# Altium schematic sheet Power-Sheet-2.SchDoc
size A4; SheetNumber: 3; SheetTotal: 10
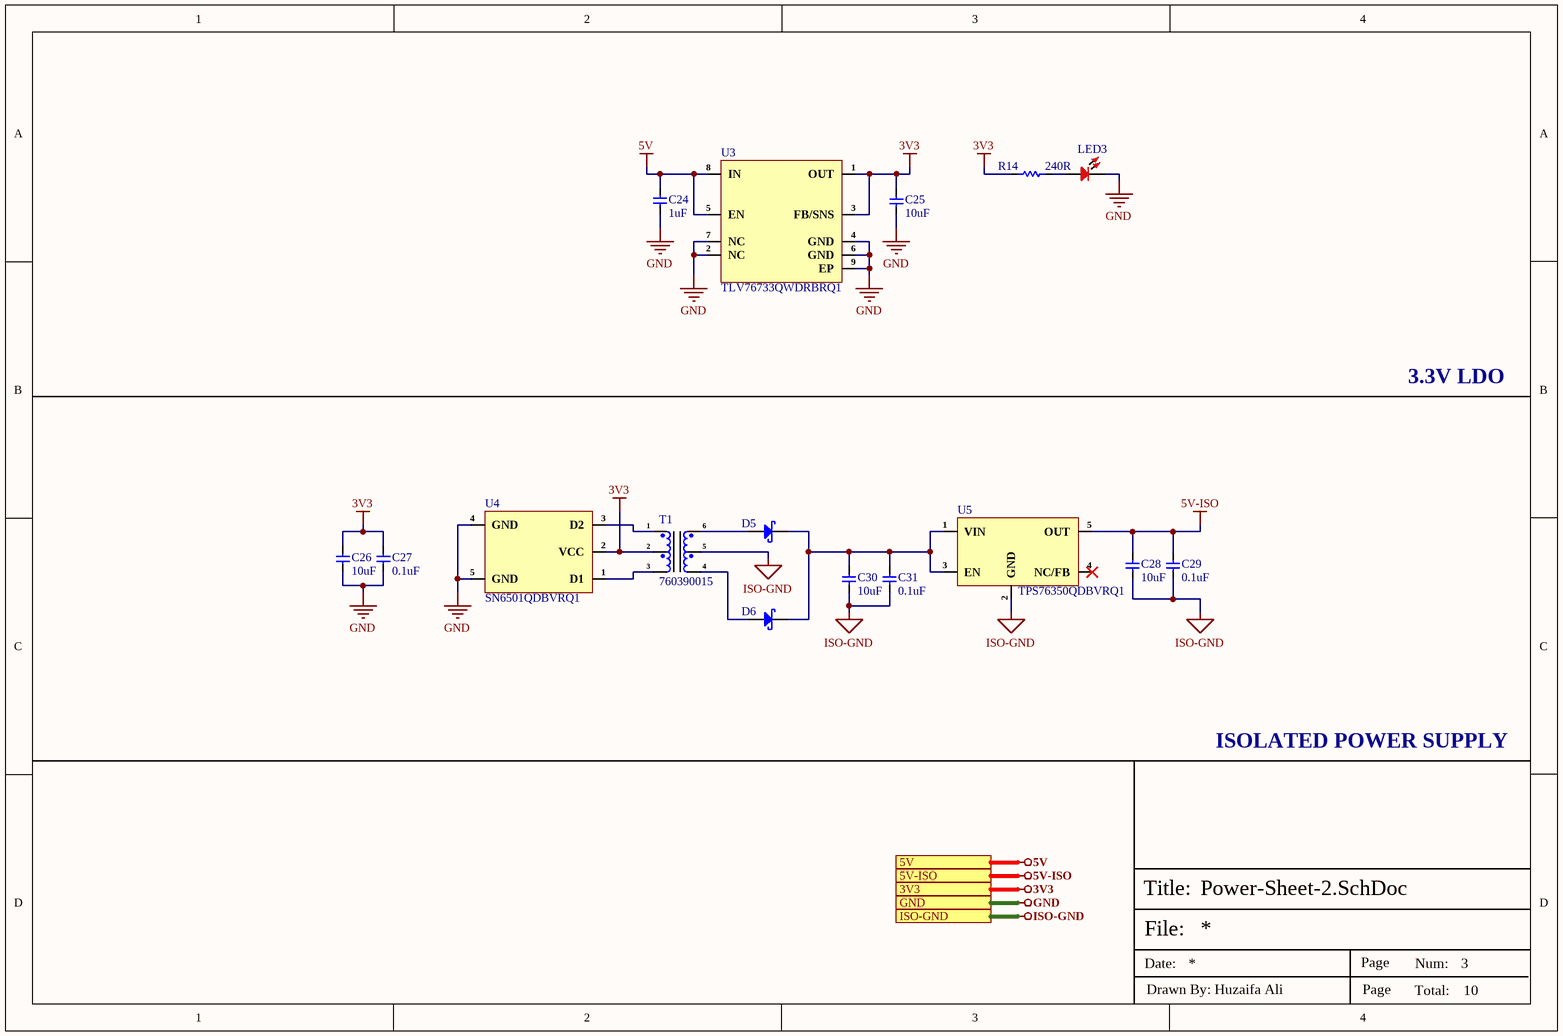
[diagram p0: Power-Sheet-2.SchDoc]

## Parts
C24  1uF  [Cap-0402]
C25  10uF  [Cap-0402]
C26  10uF  [Cap-0402]
C27  0.1uF  [Cap-0402]
C28  10uF  [Cap-0402]
C29  0.1uF  [Cap-0402]
C30  10uF  [Cap-0402]
C31  0.1uF  [Cap-0402]
D5  MBR0520LT1G  [SOD-123]  (value not drawn)
D6  MBR0520LT1G  [SOD-123]  (value not drawn)
LED3  RED  [LED-0603]  (value not drawn)
R14  240R  [Res-0402]
T1  760390015  [760390015]
U3  TLV76733QWDRBRQ1  [8-SON (3x3)]
U4  SN6501QDBVRQ1  [SOT-23-5]
U5  TPS76350QDBVRQ1  [SOT-23-5]

## Ports
3V3 (see Top-Sheet[1B], CAN-Transceiver-Sheet[3D], Controller-Sheet[3D], Fuel-Sensor-Sheet[4C], Storage-Sheet[3D], Tank-Level-Sensor-Sheet[3D], USB-to-UART-Sheet[3D]), 5V (see Top-Sheet[1B], CAN-Transceiver-Sheet[3D], Connector-Sheet[3D], Fuel-Sensor-Sheet[4C], Power-Sheet-1[3D]), 5V-ISO (see Top-Sheet[1B], CAN-Transceiver-Sheet[3D]), GND (see Top-Sheet[1B], CAN-Transceiver-Sheet[3D], Connector-Sheet[3D], Controller-Sheet[3D], Fuel-Sensor-Sheet[4C], Power-Sheet-1[3D], Storage-Sheet[3D], Tank-Level-Sensor-Sheet[3D], USB-to-UART-Sheet[3D]), ISO-GND (see Top-Sheet[1B], CAN-Transceiver-Sheet[3D], Connector-Sheet[3D])

## Nets
3V3: C25.2 C26.2 C27.2 R14.1 T1.2 U3.1(OUT) U3.3(FB/SNS) U4.2(VCC) ; port 3V3
5V: C24.1 U3.5(EN) U3.8(IN) ; port 5V
5V-ISO: C28.2 C29.2 U5.5(OUT) ; port 5V-ISO
GND: C24.2 C25.1 C26.1 C27.1 LED3.2 U3.2(NC) U3.4(GND) U3.6(GND) U3.7(NC) U3.9(EP) U4.4(GND) U4.5(GND) ; port GND
ISO-GND: C28.1 C29.1 C30.1 C31.1 T1.5 U5.2(GND) ; port ISO-GND
NetC30_2: C30.2 C31.2 D5.2(K) D6.2(K) U5.1(VIN) U5.3(EN)
NetD5_1: D5.1(A) T1.6
NetD6_1: D6.1(A) T1.4
NetLED3_1: LED3.1 R14.2
NetT1_1: T1.1 U4.3(D2)
NetT1_3: T1.3 U4.1(D1)

Not connected (* = marked no-connect by the designer): U5 4(NC/FB)*

## Notes on the sheet
- 3.3V LDO
- ISOLATED POWER SUPPLY
- File:
- Title:
- Date:
- Page
- Num:
- Total:
- Drawn By: Huzaifa Ali

## Library data of the parts
C24 = CL05A105KA5NQNC: CAP CER 1UF 25V X5R 0402; Manufacturer: Samsung; Material: Ceramic; Tolerance: 10%; Item Type: Capacitor; Supplier 1: Arrow Electronics; Manufacturer Part Number: CL05A105KA5NQNC; RoHS: Yes; Category: Ceramic Capacitors; Stock 1: 80000; Pricing 1: 10000=0.0256, 20000=0.0238, 30000=0.0228, 50000=0.0207, 100000=0.0175, 250000=0.0157 (USD); Mounting Technology: Surface Mount; Case/Package: 0402; Case Code (Metric): 1005; Case Code (Imperial): 0402; Min Operating Temperature: -55°C; Max Operating Temperature: 85°C; Package Quantity: 10000; Series: CL; Voltage Rating: 25V; Packaging: Tape and Reel; Construction: Flat; Value: 1uF; Dielectric: X5R; Length: 1mm; Width: 0.02inch; Height: 0.5mm; Depth: 0.5mm; Thickness: 0.022inch; Radiation Hardening: No; Lead Free: Lead Free; RoHS Compliant: Yes; ComponentLink1URL: https://datasheet.ciiva.com/25720/cl05a105ka5nqnc-25720771.pdf?src-supplier=Digi-Key; ComponentLink1Description: https://datasheet.ciiva.com/25720/cl05a105ka5nqnc-25720771.pdf?src-supplier=Digi-Key; ComponentLink2URL: https://datasheet.ciiva.com/3777/cl05a105ka5nqnc-3777709.pdf?src-supplier=Arrow+Electronics; ComponentLink2Description: https://datasheet.ciiva.com/3777/cl05a105ka5nqnc-3777709.pdf?src-supplier=Arrow+Electronics; ComponentLink3URL: https://datasheet.ciiva.com/29198/459147-da-01-en-vs-kondensator-0402-29198339.pdf?src-supplier=Conrad; ComponentLink3Description: https://datasheet.ciiva.com/29198/459147-da-01-en-vs-kondensator-0402-29198339.pdf?src-supplier=Conrad; Supplier Part Number 1: CL05A105KA5NQNC; LCSC Part Number: C52923
C25 C26 C28 C30 = CC0402MRX5R6BB106: CAP CER 10UF 10V X5R 0402; Manufacturer: Yageo; Tolerance: 20%; Item Type: Capacitor; Supplier 1: Future Electronics; Manufacturer Part Number: CC0402MRX5R6BB106; RoHS: Yes; Category: Ceramic Capacitors; Stock 1: 80000; Pricing 1: 10000=0.02650, 20000=0.02590, 30000=0.02550, 40000=0.02530, 50000=0.02450 (USD); Mount: Surface Mount; Case/Package: 0402; Case Code (Imperial): 0402; Case Code (Metric): 1005; Min Operating Temperature: -55°C; Max Operating Temperature: 85°C; Packaging: Tape and Reel; Capacitance: 10uF; Voltage Rating: 10V; RoHS Compliant: Yes; ComponentLink1URL: http://www.yageo.com/documents/recent/UPY-GPHC_X5R_4V-to-50V_25.pdf?src-supplier=Digi-Key; ComponentLink1Description: http://www.yageo.com/documents/recent/UPY-GPHC_X5R_4V-to-50V_25.pdf?src-supplier=Digi-Key; Supplier Part Number 1: 6097631; LCSC Part Number: C962143
C27 C29 C31 = CL05B104KB54PNC: CAP CER 0.1UF 50V X7R 0402; Manufacturer: Samsung; Supplier 1: Digi-Key; Manufacturer Part Number: CL05B104KB54PNC; Stock 1: 8594; Pricing 1: 1=0.1, 10=0.067, 50=0.0366, 100=0.0299, 500=0.02138, 1000=0.01681, 2500=0.01528, 5000=0.01406 (USD); Supplier Part Number 1: 1276-CL05B104KB54PNCDKR-ND; LCSC Part Number: C307331
D5 D6 = MBR0520LT1G: DIODE SCHOTTKY 20V 500MA SOD123; Manufacturer: ON Semiconductor; Forward Voltage: 385mV; Polarity: Standard; Max Surge Current: 5.5A; Max Reverse Current: 250uA; Element Configuration: Single; Supplier: Digikey; Supplier Part Number: MBR0520LT1GOSDKR-ND; Manufacturer Part Number: MBR0520LT1G; RoHS: Yes; Category: Schottky Diodes; Pricing: 1=0.36, 10=0.255, 100=0.129, 500=0.1052, 1000=0.07805 (USD); Case/Package: SOD-123-2; Pins: 2; Min Operating Temperature: -65°C; Max Operating Temperature: 125°C; Voltage Rating (DC): 20V; Current Rating: 500mA; Output Current: 500mA; Packaging: Tape and Reel; Package Quantity: 1; Forward Current: 500mA; Average Rectified Current: 500mA; Max Reverse Leakage Current: 250uA; Max Repetitive Reverse Voltage (Vrrm): 20V; Peak Non-Repetitive Surge Current: 5.5A; Max Forward Surge Current (Ifsm): 5.5A; Termination: SMD/SMT; Max Reverse Voltage (DC): 20V; Series: -; Length: 2.69mm; Width: 1.6mm; Height: 1.12mm; Radiation Hardening: No; Lead Free: Lead Free; Reach SVHC Compliant: No; RoHS Compliant: Yes; ComponentLink1URL: https://datasheet.ciiva.com/915/mbr0520lt1-d-915488.pdf?src-supplier=Avnet; ComponentLink1Description: https://datasheet.ciiva.com/915/mbr0520lt1-d-915488.pdf?src-supplier=Avnet; ComponentLink2URL: https://datasheet.ciiva.com/915/mbr0520lt1-d-915488.pdf?src-supplier=Digikey; ComponentLink2Description: https://datasheet.ciiva.com/915/mbr0520lt1-d-915488.pdf?src-supplier=Digikey; ComponentLink3URL: https://datasheet.ciiva.com/14168/sy600925-e-14168052.pdf?src-supplier=Distrelec; ComponentLink3Description: https://datasheet.ciiva.com/14168/sy600925-e-14168052.pdf?src-supplier=Distrelec; ComponentLink4URL: https://datasheet.ciiva.com/5762/mbr0520lt1-d-5762891.pdf?src-supplier=Farnell; ComponentLink4Description: https://datasheet.ciiva.com/5762/mbr0520lt1-d-5762891.pdf?src-supplier=Farnell; ComponentLink5URL: https://datasheet.ciiva.com/7962/mbr0520lt1-d-7962698.pdf?src-supplier=Element14; ComponentLink5Description: https://datasheet.ciiva.com/7962/mbr0520lt1-d-7962698.pdf?src-supplier=Element14; ComponentLink6URL: https://datasheet.ciiva.com/5762/mbr0520lt1-d-5762889.pdf?src-supplier=Farnell; ComponentLink6Description: https://datasheet.ciiva.com/5762/mbr0520lt1-d-5762889.pdf?src-supplier=Farnell; ComponentLink7URL: https://datasheet.ciiva.com/14559/70099495-14559898.pdf?src-supplier=Allied+Electronics; ComponentLink7Description: https://datasheet.ciiva.com/14559/70099495-14559898.pdf?src-supplier=Allied+Electronics; ComponentLink8URL: https://datasheet.ciiva.com/4714/mbr0520lt1-d-94265-4714156.pdf?src-supplier=Mouser; ComponentLink8Description: https://datasheet.ciiva.com/4714/mbr0520lt1-d-94265-4714156.pdf?src-supplier=Mouser; ComponentLink9URL: https://datasheet.ciiva.com/7961/mbr0520lt1-d-7961765.pdf?src-supplier=Element14; ComponentLink9Description: https://datasheet.ciiva.com/7961/mbr0520lt1-d-7961765.pdf?src-supplier=Element14; ComponentLink10URL: https://datasheet.ciiva.com/7962/mbr0520lt1-d-7962699.pdf?src-supplier=Element14; ComponentLink10Description: https://datasheet.ciiva.com/7962/mbr0520lt1-d-7962699.pdf?src-supplier=Element14; ComponentLink11URL: https://datasheet.ciiva.com/16395/mbr0520lt1-d-16395977.pdf?src-supplier=Future+Electronics; ComponentLink11Description: https://datasheet.ciiva.com/16395/mbr0520lt1-d-16395977.pdf?src-supplier=Future+Electronics; ComponentLink12URL: https://datasheet.ciiva.com/915/mbr0520lt1-d-915489.pdf?src-supplier=Digikey; ComponentLink12Description: https://datasheet.ciiva.com/915/mbr0520lt1-d-915489.pdf?src-supplier=Digikey; ComponentLink13URL: https://datasheet.ciiva.com/915/mbr0520lt1-d-915490.pdf?src-supplier=Digikey; ComponentLink13Description: https://datasheet.ciiva.com/915/mbr0520lt1-d-915490.pdf?src-supplier=Digikey; LCSC Part Number: C23848; Item Type: Diode
LED3 = NCD0603R3: RED LED 0603 Light Emitting Diodes; Manufacturer: Foshan NationStar Optoelectronics; Manufacturer Part Number: NCD0603R3; Package: 0603; Item Type: LED; LCSC Part Number: C3151730; ComponentLink1Description: LCSC; ComponentLink1URL: https://www.lcsc.com/product-detail/Light-Emitting-Diodes-LED_Foshan-NationStar-Optoelectronics-NCD0603R3_C3151730.html
R14 = RC0402FR-07240RL: RES 240 OHM 1% 1/16W 0402; Manufacturer: Yageo; Power Rating: 63mW; Temperature Coefficient: 100ppm/°C; Voltage Rating (DC): 50V; Supplier 1: Mouser; Manufacturer Part Number: RC0402FR-07240RL; RoHS: Yes; Category: Chip SMD Resistors; Stock 1: 1903202; Pricing 1: 1=0.10000, 10=0.01200, 50=0.01200, 100=0.00500, 1000=0.00300, 10000=0.00100 (USD); Case/Package: 0402; Case Code (Metric): 1005; Case Code (Imperial): 0402; Size Code: 0402; Min Operating Temperature: -55°C; Max Operating Temperature: 155°C; Resistance: 240R; Tolerance: 1%; Packaging: Tape and Reel; Resistor Type: Thick Film; Voltage Rating: 50V; Package Quantity: 1; Number of Terminations: 2; Termination: SMD/SMT; Max Power Dissipation: 63mW; Features: Moisture Resistant; Series: RC; Construction: Rectangular; Resistance Tolerance: 1%; Length: 1mm; Width: 0.02inch; Height: 0.016inch; Depth: 0.5mm; REACH SVHC: Unknown; Lead Free: Lead Free; RoHS Compliant: Yes; Military Standard: Not; ComponentLink1URL: https://datasheet.ciiva.com/7849/1018594-7849915.pdf?src-supplier=Element14; ComponentLink1Description: https://datasheet.ciiva.com/7849/1018594-7849915.pdf?src-supplier=Element14; ComponentLink2URL: https://datasheet.ciiva.com/7849/1018594-7849916.pdf?src-supplier=Element14; ComponentLink2Description: https://datasheet.ciiva.com/7849/1018594-7849916.pdf?src-supplier=Element14; ComponentLink3URL: https://datasheet.ciiva.com/2519/pyu-r-int-thick-7-2519157.pdf?src-supplier=Digi-Key; ComponentLink3Description: https://datasheet.ciiva.com/2519/pyu-r-int-thick-7-2519157.pdf?src-supplier=Digi-Key; ComponentLink4URL: https://datasheet.ciiva.com/2519/pyu-r-int-thick-7-2519158.pdf?src-supplier=Digi-Key; ComponentLink4Description: https://datasheet.ciiva.com/2519/pyu-r-int-thick-7-2519158.pdf?src-supplier=Digi-Key; ComponentLink5URL: https://datasheet.ciiva.com/2519/pyu-r-int-thick-7-2519156.pdf?src-supplier=Digi-Key; ComponentLink5Description: https://datasheet.ciiva.com/2519/pyu-r-int-thick-7-2519156.pdf?src-supplier=Digi-Key; ComponentLink6URL: https://datasheet.ciiva.com/12669/pyu-rc0402-51-rohs-l-6-r-12669689.pdf?src-supplier=Mouser; ComponentLink6Description: https://datasheet.ciiva.com/12669/pyu-rc0402-51-rohs-l-6-r-12669689.pdf?src-supplier=Mouser; ComponentLink7URL: https://datasheet.ciiva.com/17419/pyu-rc0402-51-rohs-l-6-r-17419482.pdf?src-supplier=Future+Electronics; ComponentLink7Description: https://datasheet.ciiva.com/17419/pyu-rc0402-51-rohs-l-6-r-17419482.pdf?src-supplier=Future+Electronics; Supplier Part Number 1: 603-RC0402FR-07240RL
T1 = 760390015: TRANSFORMER 475UH SMD; Manufacturer: Wurth Electronics; Frequency: 10kHz; Current Rating: 150mA; Isolation Voltage: 2.5kV; Supplier: Rs; Supplier Part Number: 1828986P; Manufacturer Part Number: 760390015; RoHS: Yes; Category: Transformers; Stock: 435; Pricing: 25=1.438, 100=1.36, 250=1.312, 500=1.226 (GBP); Mounting Technology: Surface Mount; Case/Package: SMD/SMT; Min Operating Temperature: -40°C; Max Operating Temperature: 125°C; Package Quantity: 1; Packaging: Tape and Reel; Termination: SMD/SMT; Value: 475uH; Series: WE-PP; Max DC Current: 150mA; Length: 10.05mm; Width: 10.05mm; Height: 4.19mm; Height - Seated (Max): 4.19mm; RoHS Compliant: Yes; ComponentLink1URL: https://datasheet.ciiva.com/12335/760390015-221218-12335392.pdf?src-supplier=Mouser; ComponentLink1Description: https://datasheet.ciiva.com/12335/760390015-221218-12335392.pdf?src-supplier=Mouser; Item Type: TRANSFORMER
U3 = TLV76733QWDRBRQ1: IC REG LIN 3.3V 1A 8SON; Manufacturer: Texas Instruments; Supplier: Mouser; Supplier Part Number: 595-TLV76733QWDRBRQ1; Manufacturer Part Number: TLV76733QWDRBRQ1; RoHS: Yes; Category: Voltage Regulators - Linear; Stock: 18312; Pricing: 1=1.43, 10=1.22, 50=1.22, 100=0.932, 1000=0.663, 10000=0.566 (USD); LCSC Part Number: C5220143; Item Type: IC
U4 = SN6501QDBVRQ1: IC XFRMR DRVR NCH 350MA SOT23-5; Manufacturer: Texas Instruments; Number of Outputs: 1; Min Input Voltage: 3V; Output Voltage: 11V; Max Supply Voltage: 5.5V; Operating Supply Current: 300uA; Switching Frequency: 620kHz; Supplier: Mouser; Supplier Part Number: 595-SN6501QDBVRQ1; Manufacturer Part Number: SN6501QDBVRQ1; RoHS: Yes; Category: Voltage Regulators - Switching; Stock: 21713; Pricing: 1=2.1, 10=1.89, 50=1.89, 100=1.52, 1000=1.13, 10000=0.924 (USD); Mounting Technology: Surface Mount; Case/Package: SOT-23-5; Min Operating Temperature: -40°C; Max Operating Temperature: 125°C; Output Current: 350mA; Package Quantity: 3000; Packaging: Tape and Reel; Max Output current: 350mA; Min Supply Voltage: 3V; Series: Automotive, AEC-Q100; Radiation Hardening: No; Reach SVHC Compliant: No; Lead Free: Lead Free; RoHS Compliant: Yes; ComponentLink1URL: https://datasheet.ciiva.com/25648/sn6501-q1-25648933.pdf?src-supplier=Digikey; ComponentLink1Description: https://datasheet.ciiva.com/25648/sn6501-q1-25648933.pdf?src-supplier=Digikey; ComponentLink2URL: https://datasheet.ciiva.com/24116/sllsef3-267274-24116311.pdf?src-supplier=Mouser; ComponentLink2Description: https://datasheet.ciiva.com/24116/sllsef3-267274-24116311.pdf?src-supplier=Mouser; ComponentLink3URL: https://datasheet.ciiva.com/29590/sn6501-q1-29590029.pdf?src-supplier=Digikey; ComponentLink3Description: https://datasheet.ciiva.com/29590/sn6501-q1-29590029.pdf?src-supplier=Digikey; ComponentLink4URL: https://datasheet.ciiva.com/29590/sn6501-q1-29590030.pdf?src-supplier=Digikey; ComponentLink4Description: https://datasheet.ciiva.com/29590/sn6501-q1-29590030.pdf?src-supplier=Digikey; ComponentLink5URL: https://datasheet.ciiva.com/30031/sn6501-q1-30031541.pdf?src-supplier=Avnet; ComponentLink5Description: https://datasheet.ciiva.com/30031/sn6501-q1-30031541.pdf?src-supplier=Avnet; LCSC Part Number: C544575; Item Type: IC
U5 = TPS76350QDBVRQ1: IC REG LINEAR 5V 150MA SOT23-5; Manufacturer: Texas Instruments; Dropout Voltage: 180mV; Number of Outputs: 1; Max Power Dissipation: 555mW; Max Supply Voltage: 10V; Min Input Voltage: 2.7V; Min Current Limit: 500mA; Input Bias Current: 85uA; Reference Voltage: 1.192V; Polarity: Positive; Quiescent Current: 80uA; Output Voltage Accuracy: 3%; Output Type: Fixed; Supplier: Mouser; Supplier Part Number: 595-TPS76350QDBVRQ1; Manufacturer Part Number: TPS76350QDBVRQ1; RoHS: Yes; Category: Voltage Regulators - Linear; Stock: 7424; Pricing: 1=1.15, 10=1.03, 50=1.03, 100=0.81, 1000=0.528, 10000=0.451 (USD); Case/Package: SOT-23-5; Pins: 5; Min Operating Temperature: -40°C; Max Operating Temperature: 125°C; Package Quantity: 3000; Packaging: Tape and Reel; Output Voltage: 5V; Output Current: 150mA; Max Output current: 150mA; Number of Regulators: 1; Power Dissipation: 555mW; Accuracy: 3%; Max Output Voltage: 5V; Min Output Voltage: 5V; Series: Automotive, AEC-Q100; Length: 2.9mm; Width: 1.6mm; Height: 1.45mm; Thickness: 1.2mm; Radiation Hardening: No; Lead Free: Lead Free; RoHS Compliant: Yes; ComponentLink1URL: https://datasheet.ciiva.com/2044/tps76318-q1-2044688.pdf?src-supplier=Digikey; ComponentLink1Description: https://datasheet.ciiva.com/2044/tps76318-q1-2044688.pdf?src-supplier=Digikey; Item Type: IC